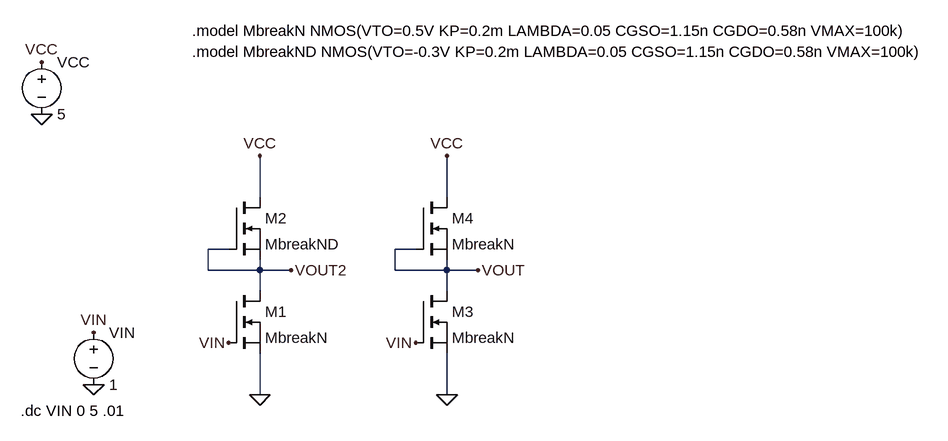
[diagram p0: schematic I_1.asc]
I_1.asc, the LTspice schematic file:
Version 4.1
SHEET 1 1412 680
WIRE 320 112 320 48
WIRE 608 112 608 48
WIRE 272 192 240 192
WIRE 560 192 528 192
WIRE 240 224 240 192
WIRE 320 224 320 208
WIRE 320 224 240 224
WIRE 368 224 320 224
WIRE 528 224 528 192
WIRE 608 224 608 208
WIRE 608 224 528 224
WIRE 656 224 608 224
WIRE 320 256 320 224
WIRE 608 256 608 224
WIRE 320 416 320 352
WIRE 608 416 608 352
FLAG 320 416 0
FLAG -16 -16 0
FLAG -16 -96 VCC
FLAG 320 48 VCC
FLAG 64 400 0
FLAG 64 320 VIN
FLAG 272 336 VIN
FLAG 368 224 VOUT2
FLAG 608 416 0
FLAG 608 48 VCC
FLAG 560 336 VIN
FLAG 656 224 VOUT
SYMBOL nmos 272 256 R0
SYMATTR InstName M1
SYMATTR Value MbreakN
SYMBOL voltage -16 -112 R0
WINDOW 123 0 0 Left 0
WINDOW 39 0 0 Left 0
SYMATTR InstName VCC
SYMATTR Value 5
SYMBOL nmos 272 112 R0
SYMATTR InstName M2
SYMATTR Value MbreakND
SYMBOL voltage 64 304 R0
WINDOW 123 0 0 Left 0
WINDOW 39 0 0 Left 0
SYMATTR InstName VIN
SYMATTR Value 1
SYMBOL nmos 560 256 R0
SYMATTR InstName M3
SYMATTR Value MbreakN
SYMBOL nmos 560 112 R0
SYMATTR InstName M4
SYMATTR Value MbreakN
TEXT 216 -144 Left 2 !.model MbreakN NMOS(VTO=0.5V KP=0.2m LAMBDA=0.05 CGSO=1.15n CGDO=0.58n VMAX=100k)
TEXT 216 -112 Left 2 !.model MbreakND NMOS(VTO=-0.3V KP=0.2m LAMBDA=0.05 CGSO=1.15n CGDO=0.58n VMAX=100k)
TEXT -48 440 Left 2 !.dc VIN 0 5 .01

The netlist it stands for:
* I_1.asc
M1 VOUT2 VIN 0 0 MbreakN
VCC VCC 0 5
M2 VCC VOUT2 VOUT2 VOUT2 MbreakND
VIN VIN 0 1
M3 VOUT VIN 0 0 MbreakN
M4 VCC VOUT VOUT VOUT MbreakN
.model NMOS NMOS
.model PMOS PMOS
.lib standard.mos
.model MbreakN NMOS(VTO=0.5V KP=0.2m LAMBDA=0.05 CGSO=1.15n CGDO=0.58n VMAX=100k)
.model MbreakND NMOS(VTO=-0.3V KP=0.2m LAMBDA=0.05 CGSO=1.15n CGDO=0.58n VMAX=100k)
.dc VIN 0 5 .01
.backanno
.end